# Altium schematic sheet PWM_Generator.SchDoc
size A; SheetNumber: 1; SheetTotal: 7
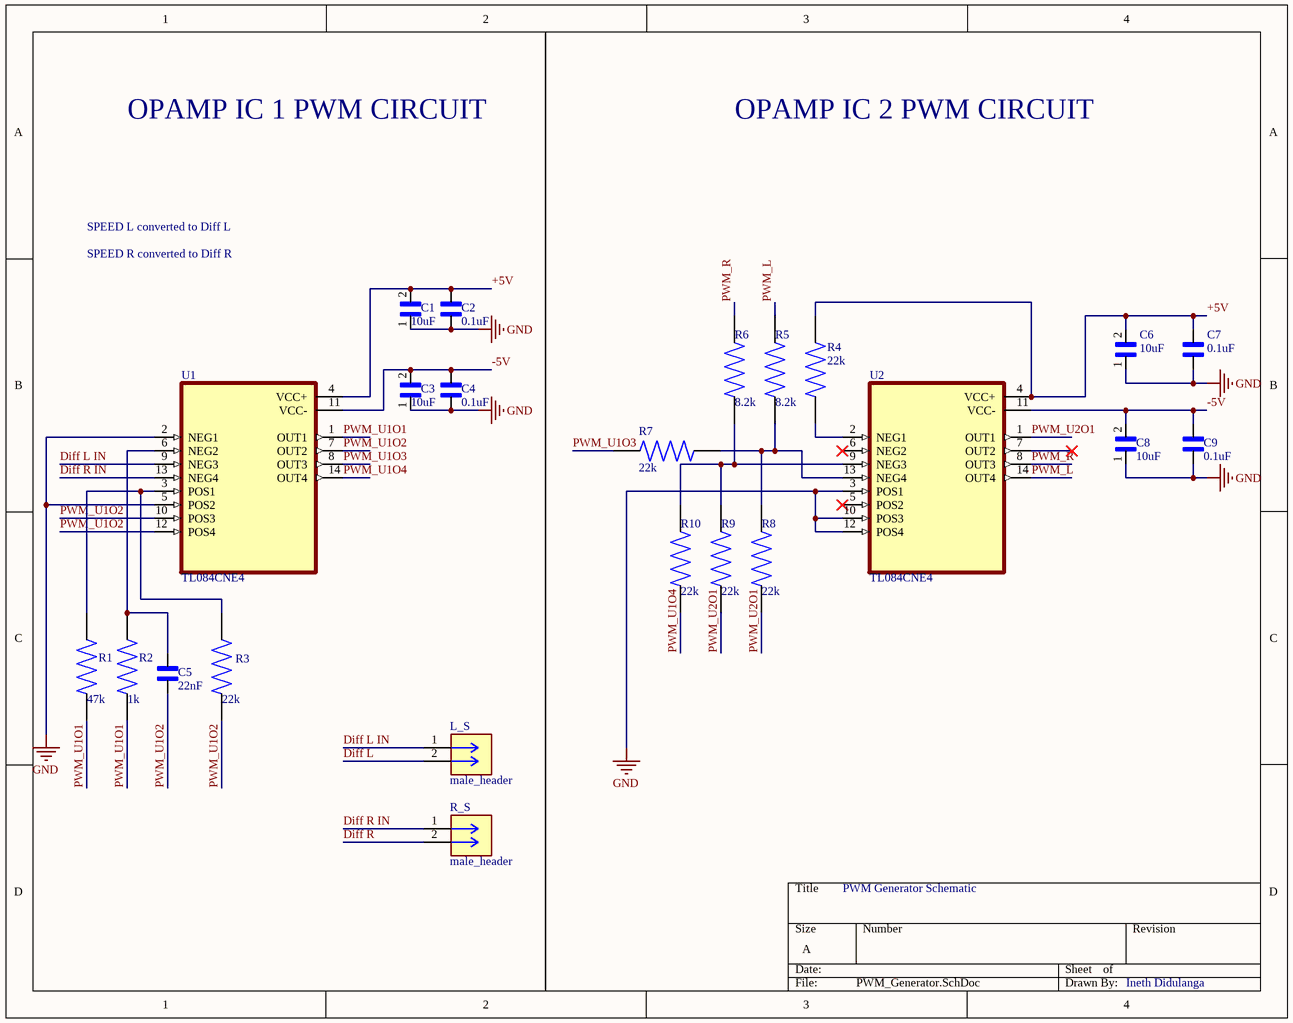
[diagram p0: PWM_Generator.SchDoc]

## Parts
C1  10uF  [CAPC2012X145N]
C2  0.1uF  [CAPC2012X140N]
C3  10uF  [CAPC2012X145N]
C4  0.1uF  [CAPC2012X140N]
C5  22nF  [CAPC2012X135N]
C6  10uF  [CAPC2012X145N]
C7  0.1uF  [CAPC2012X140N]
C8  10uF  [CAPC2012X145N]
C9  0.1uF  [CAPC2012X140N]
L_S  male_header  [CONN02_901200922_MOL]
R1  47k  [RESC2012X65N]
R2  1k  [RESC2012X55N]
R3  22k  [RESC2012X65N]
R4  22k  [RESC2012X65N]
R5  8.2k  [RESC2012X65N]
R6  8.2k  [RESC2012X65N]
R7  22k  [RESC2012X65N]
R8  22k  [RESC2012X65N]
R9  22k  [RESC2012X65N]
R10  22k  [RESC2012X65N]
R_S  male_header  [CONN02_901200922_MOL]
U1  TL084CNE4  [SOIC127P780X200-14N]
U2  TL084CNE4  [SOIC127P780X200-14N]

## Nets
GND: C1.1 C2.2 C3.1 C4.2 C6.1 C7.2 C8.1 C9.2 U1.2(NEG1) U1.5(POS2) U2.3(POS1) U2.10(POS3) U2.12(POS4)
+5V: C1.2 C2.1 C6.2 C7.1 R4.2 U1.4(VCC+) U2.4(VCC+)
-5V: C3.2 C4.1 C8.2 C9.1 U1.11(VCC-) U2.11(VCC-)
Diff L: L_S.2
Diff L IN: L_S.1 U1.9(NEG3)
Diff R: R_S.2
Diff R IN: R_S.1 U1.13(NEG4)
PWM_L: R5.2 U2.14(OUT4)
PWM_R: R6.2 U2.8(OUT3)
PWM_U1O1: R1.1 R2.1 U1.1(OUT1)
PWM_U1O2: C5.1 R3.1 U1.7(OUT2) U1.10(POS3) U1.12(POS4)
PWM_U1O3: R7.1 U1.8(OUT3)
PWM_U1O4: R10.1 U1.14(OUT4)
PWM_U2O1: R8.1 R9.1 U2.1(OUT1)
NetC5_2: C5.2 R2.2 U1.6(NEG2)
NetR1_2: R1.2 R3.2 U1.3(POS1)
NetR4_1: R4.1 U2.2(NEG1)
NetR5_1: R5.1 R7.2 R8.2 U2.13(NEG4)
NetR6_1: R6.1 R9.2 R10.2 U2.9(NEG3)

Not connected (* = marked no-connect by the designer): U2 5(POS2)* 6(NEG2)* 7(OUT2)*

## Notes on the sheet
- OPAMP IC 1 PWM CIRCUIT
- OPAMP IC 2 PWM CIRCUIT
- SPEED L converted to Diff L
- SPEED R converted to Diff R
- PWM Generator Schematic
- Ineth Didulanga

## Library data of the parts
C1 C3 C6 C8 = C2012X6S1C106K125AC: C Series 0805 10 uF 16 V Â±10 % Tolerance X6S SMT Multilayer Ceramic Capacitor; MF: TDK; MP: C2012X6S1C106K125AC; SnapEDA_Link: https://www.snapeda.com/parts/C2012X6S1C106K125AC/TDK-Lambda+Americas+Inc/view-part/?ref=snap; Check_prices: https://www.snapeda.com/parts/C2012X6S1C106K125AC/TDK-Lambda+Americas+Inc/view-part/?ref=eda; Value: *; Purchase-URL: https://pricing.snapeda.com/search/part/C2012X6S1C106K125AC/?ref=eda; Package: 2012 TDK
C2 C4 C7 C9 = FS055C104K4Z2A: 0.1 ÂµF Â±10% 50V Ceramic Capacitor X7R 0805 (2012 Metric); MF: AVX; SnapEDA_Link: https://www.snapeda.com/parts/FS055C104K4Z2A/AVX/view-part/?ref=snap; Package: 0805-2 AVX; Value: *; MP: FS055C104K4Z2A; Check_prices: https://www.snapeda.com/parts/FS055C104K4Z2A/AVX/view-part/?ref=eda
C5 = GRM21B5C1H223JA01L: 0805 22 nF 50 V Â±5% Tolerance C0G SMT Multilayer Ceramic Capacitor; MF: Murata; SnapEDA_Link: https://www.snapeda.com/parts/GRM21B5C1H223JA01L/Murata/view-part/?ref=snap; Package: 805-2 Murata; Value: *; MP: GRM21B5C1H223JA01L; Check_prices: https://www.snapeda.com/parts/GRM21B5C1H223JA01L/Murata/view-part/?ref=eda
L_S R_S = 901200922: Package: None; Price: None; Value: *; MP: 901200922; Availability: Unavailable
R1 = CRGCQ0805F47K: Fixed Resistor CRGCQ 0805 47K 1%; MF: TE Connectivity; SnapEDA_Link: https://www.snapeda.com/parts/CRGCQ0805F47K/TE+Connectivity/view-part/?ref=snap; Package: 2012 TE Connectivity; Value: *; MP: CRGCQ0805F47K; Check_prices: https://www.snapeda.com/parts/CRGCQ0805F47K/TE+Connectivity/view-part/?ref=eda
R2 = MCU08050C1002FPW00: Res Thin Film 0805 10K Ohm 1% 0.125W(1/8W) Â±50ppm/Â°C Sulfur Resistant Pad SMD Automotive Medical T/R; MF: Vishay; SnapEDA_Link: https://www.snapeda.com/parts/MCU08050C1002FPW00/Vishay/view-part/?ref=snap; Package: 2012 Vishay; Value: *; MP: MCU08050C1002FPW00; Check_prices: https://www.snapeda.com/parts/MCU08050C1002FPW00/Vishay/view-part/?ref=eda
R3-R10 = CRGCQ0805F22K: Fixed Resistor CRGCQ 0805 22K 1%; MF: TE Connectivity; SnapEDA_Link: https://www.snapeda.com/parts/CRGCQ0805F22K/TE+Connectivity/view-part/?ref=snap; Package: 2012 TE Connectivity; Value: *; MP: CRGCQ0805F22K; Check_prices: https://www.snapeda.com/parts/CRGCQ0805F22K/TE+Connectivity/view-part/?ref=eda
U1 U2 = TL084CNE4: Quad High Slew Rate JFET-Input Operational Amplifier 14-PDIP 0 to 70; MF: Texas Instruments; SnapEDA_Link: https://www.snapeda.com/parts/TL084CNE4/Texas+Instruments/view-part/?ref=snap; Package: PDIP-14 Texas Instruments; Value: *; MP: TL084CNE4; Check_prices: https://www.snapeda.com/parts/TL084CNE4/Texas+Instruments/view-part/?ref=eda